# Altium project Relay-Driver-Board-v1.0.PrjPcb (part 1 of 3)
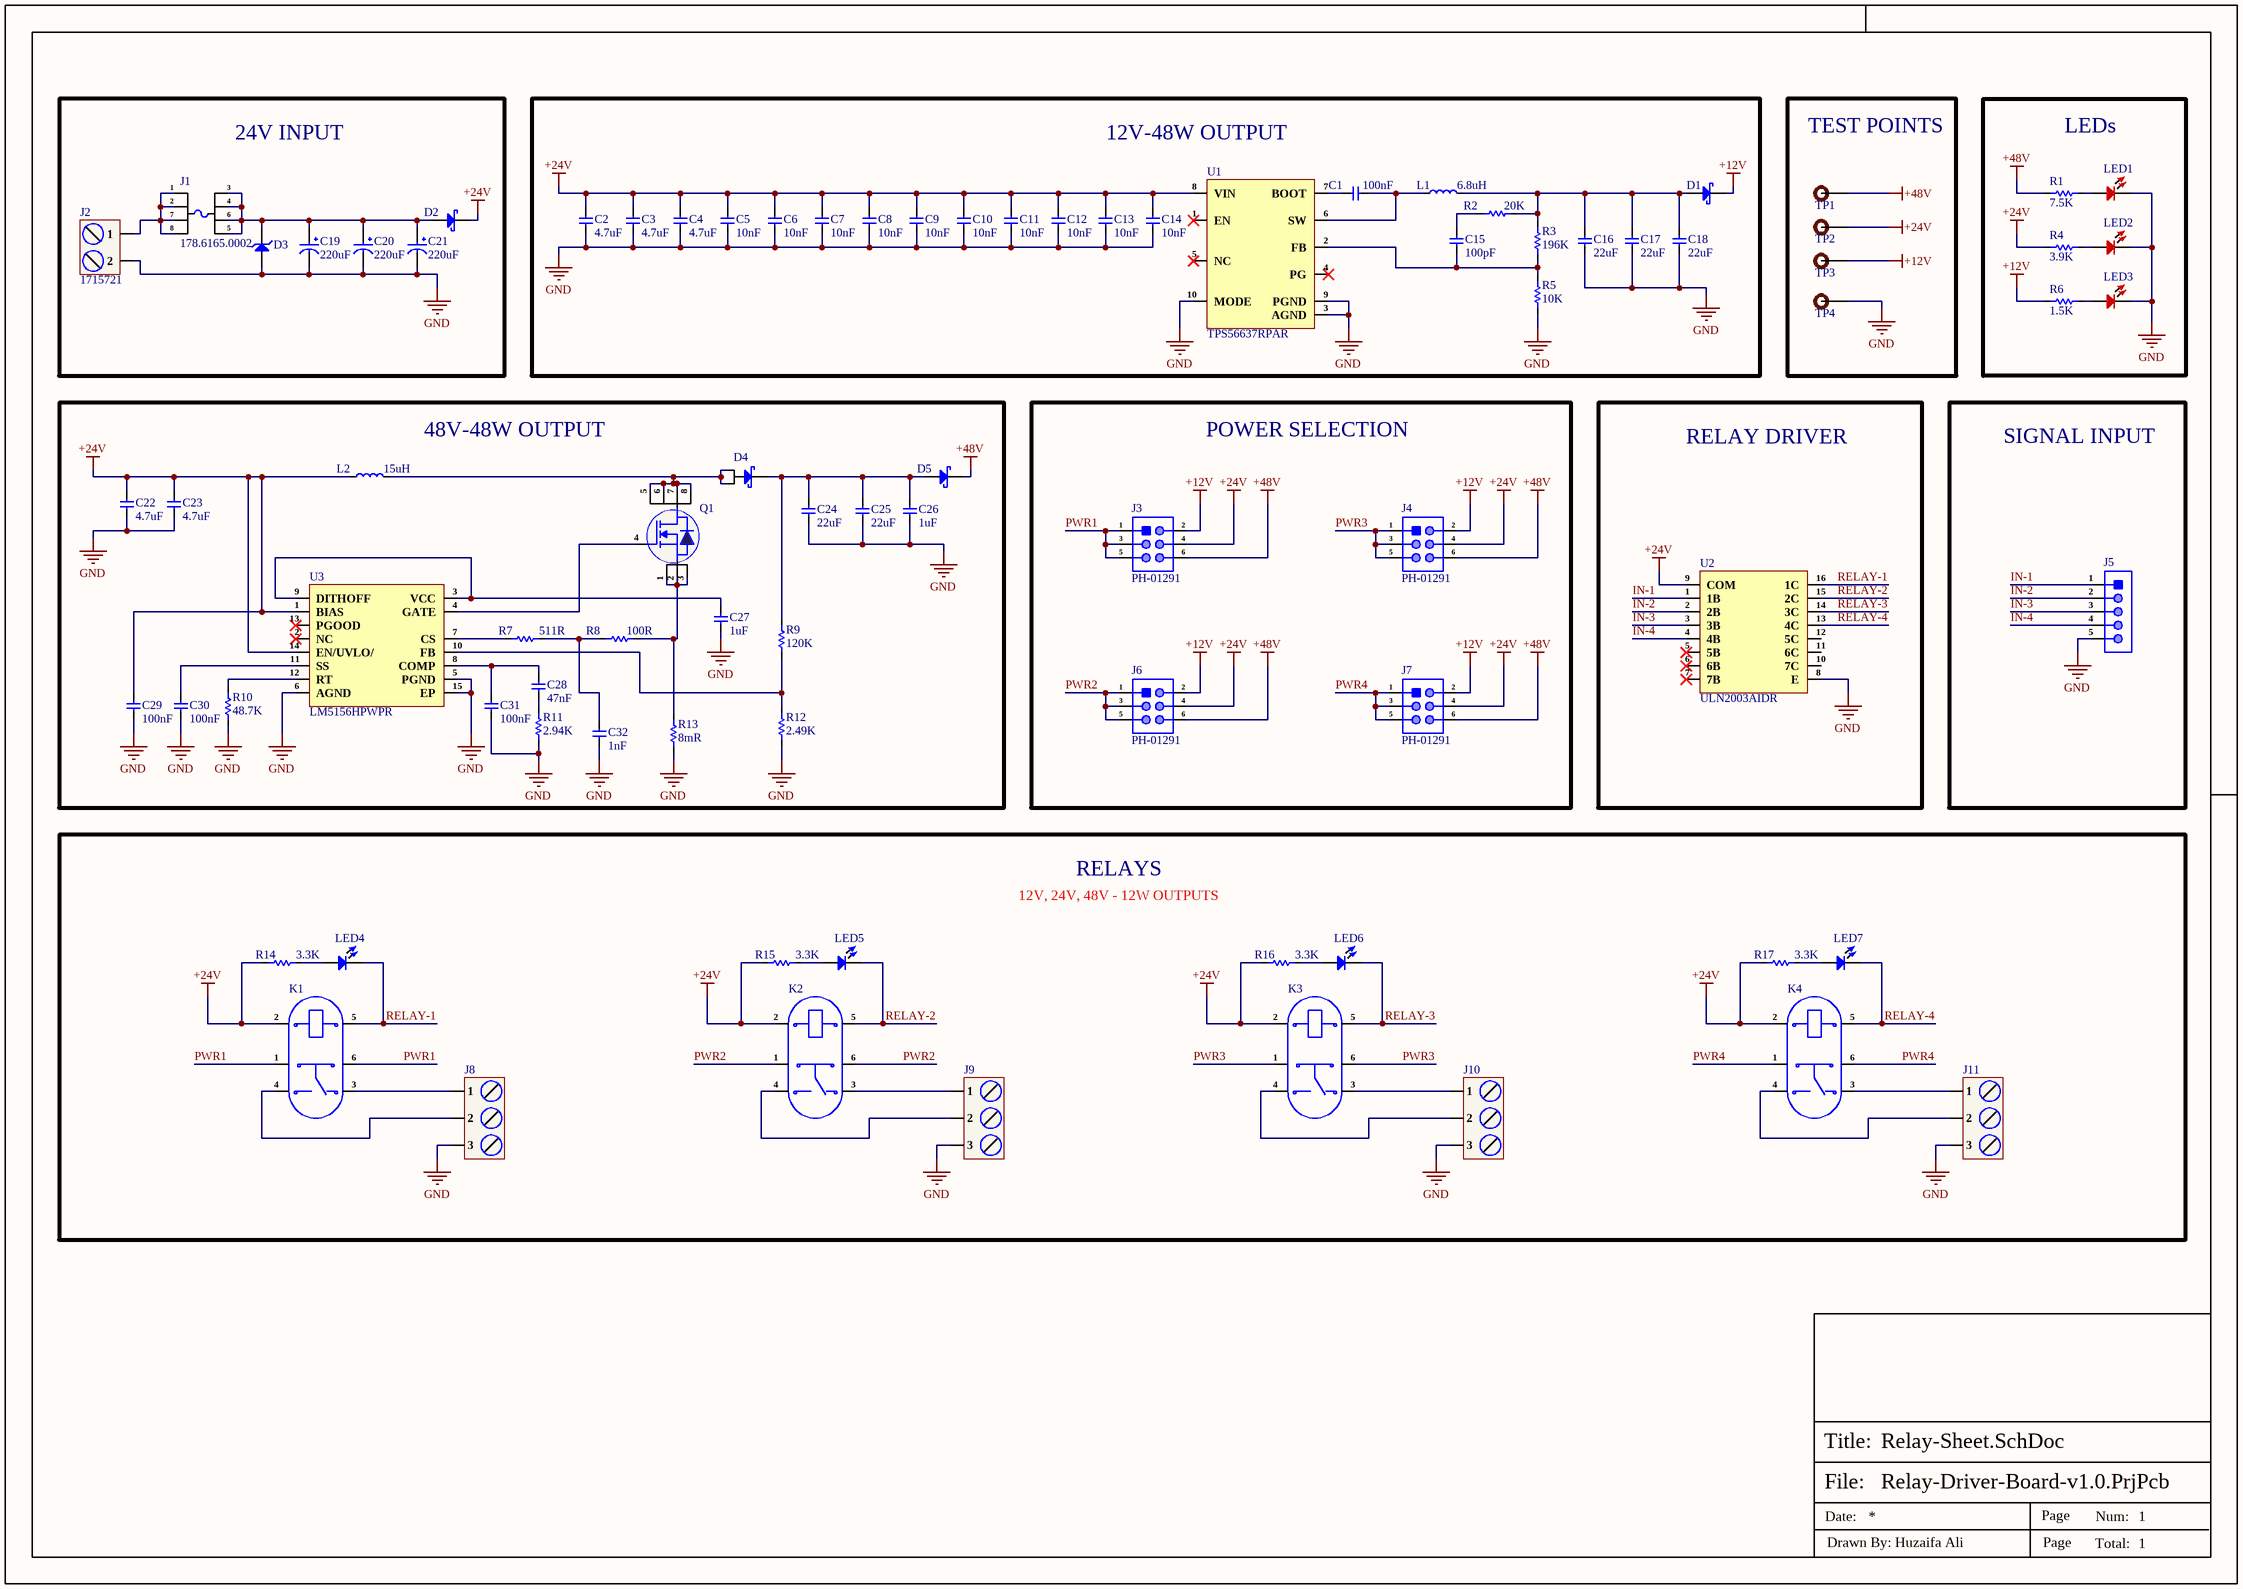
[diagram p0: Relay-Sheet.SchDoc]
1 sheet, 86 parts. Net scope: global (net labels, ports and power ports of the same name join across sheets).
Board file: Relay-Driver-Board-v1.0.PcbDoc

## Sheet Relay-Sheet.SchDoc
size 420 x 297 mm; SheetNumber: 1; SheetTotal: 1

### Parts
C1  100nF  [Cap-0603]
C2  4.7uF  [Cap-1206]
C3  4.7uF  [Cap-1206]
C4  4.7uF  [Cap-1206]
C5  10nF  [Cap-0402]
C6  10nF  [Cap-0402]
C7  10nF  [Cap-0402]
C8  10nF  [Cap-0402]
C9  10nF  [Cap-0402]
C10  10nF  [Cap-0402]
C11  10nF  [Cap-0402]
C12  10nF  [Cap-0402]
C13  10nF  [Cap-0402]
C14  10nF  [Cap-0402]
C15  100pF  [Cap-0402]
C16  22uF  [Cap-0805]
C17  22uF  [Cap-0805]
C18  22uF  [Cap-0805]
C19  220uF  [UCD-220uF-10mmDia]
C20  220uF  [UCD-220uF-10mmDia]
C21  220uF  [UCD-220uF-10mmDia]
C22  4.7uF  [Cap-1206]
C23  4.7uF  [Cap-1206]
C24  22uF  [Cap 2220]
C25  22uF  [Cap 2220]
C26  1uF  [Cap-1206]
C27  1uF  [Cap-0402]
C28  47nF  [Cap-0402]
C29  100nF  [Cap-0603]
C30  100nF  [Cap-0603]
C31  100nF  [Cap-0603]
C32  1nF  [Cap-0603]
D1  SS56  [SMA]  (value not drawn)
D2  SS56  [SMA]  (value not drawn)
D3  SMBJ28A-13-F  [SMB_]  (value not drawn)
D4  STPS20M100SG-TR  [D2Pak.]  (value not drawn)
D5  SS56  [SMA]  (value not drawn)
J1  178.6165.0002  [178.6165.0002]
J2  1715721  [1715721]
J3  PH-01291  [PH-01291]
J4  PH-01291  [PH-01291]
J5  B5B-XH-A(LF)(SN)  [B5B-XH-A(LF)(SN)_]  (value not drawn)
J6  PH-01291  [PH-01291]
J7  PH-01291  [PH-01291]
J8  DB128L-5.08-3P-BK-S  [DB128L-5.08-3P-BK-S]  (value not drawn)
J9  DB128L-5.08-3P-BK-S  [DB128L-5.08-3P-BK-S]  (value not drawn)
J10  DB128L-5.08-3P-BK-S  [DB128L-5.08-3P-BK-S]  (value not drawn)
J11  DB128L-5.08-3P-BK-S  [DB128L-5.08-3P-BK-S]  (value not drawn)
K1  HFD16/24-ZFH-3N  [HFD16/24-ZFH-3N]  (value not drawn)
K2  HFD16/24-ZFH-3N  [HFD16/24-ZFH-3N]  (value not drawn)
K3  HFD16/24-ZFH-3N  [HFD16/24-ZFH-3N]  (value not drawn)
K4  HFD16/24-ZFH-3N  [HFD16/24-ZFH-3N]  (value not drawn)
L1  6.8uH  [MWSA1206S-6R8MT]
L2  15uH  [FEXL1010A-150M]
LED1  RED  [LED-0603]  (value not drawn)
LED2  RED  [LED-0603]  (value not drawn)
LED3  RED  [LED-0603]  (value not drawn)
LED4  Blue  [LED-0603]  (value not drawn)
LED5  Blue  [LED-0603]  (value not drawn)
LED6  Blue  [LED-0603]  (value not drawn)
LED7  Blue  [LED-0603]  (value not drawn)
Q1  CSD19538Q3A  [VSONP-8(3.1x3.1)]  (value not drawn)
R1  7.5K  [Res-0402]
R2  20K  [Res-0402]
R3  196K  [Res-0603]
R4  3.9K  [Res-0402]
R5  10K  [Res-0402]
R6  1.5K  [Res-0402]
R7  511R  [Res-0402]
R8  100R  [Res-0402]
R9  120K  [Res-0402]
R10  48.7K  [Res-0603]
R11  2.94K  [Res-0402]
R12  2.49K  [Res-0402]
R13  8mR  [RES-2512]
R14  3.3K  [Res-0402]
R15  3.3K  [Res-0402]
R16  3.3K  [Res-0402]
R17  3.3K  [Res-0402]
TP1  TEST POINT  [Test-point]  (value not drawn)  (no BOM)
TP2  TEST POINT  [Test-point]  (value not drawn)  (no BOM)
TP3  TEST POINT  [Test-point]  (value not drawn)  (no BOM)
TP4  TEST POINT  [Test-point]  (value not drawn)  (no BOM)
U1  TPS56637RPAR  [10-VQFN-HR (3x3)]
U2  ULN2003AIDR  [16-SOIC (0.154", 3.90mm Width)]
U3  LM5156HPWPR  [HTSSOP-14-EP]

### Blocks framed on the sheet
24V INPUT: C19-C21 D2 D3 J1 J2
12V-48W OUTPUT: C1-C18 D1 L1 R2 R3 R5 U1
TEST POINTS: TP1-TP4
LEDs: LED1-LED3 R1 R4 R6
48V-48W OUTPUT: C22-C32 D4 D5 L2 Q1 R7-R13 U3
POWER SELECTION: J3 J4 J6 J7
RELAY DRIVER: U2
SIGNAL INPUT: J5
RELAYS: J8-J11 K1-K4 LED4-LED7 R14-R17

### Nets
+12V: D1.1(K) J3.2 J4.2 J6.2 J7.2 R6.1 TP3.1
+24V: C2.2 C3.2 C4.2 C5.2 C6.2 C7.2 C8.2 C9.2 C10.2 C11.2 C12.2 C13.2 C14.2 C22.2 C23.2 C29.1 D2.1(K) J3.4 J4.4 J6.4 J7.4 K1.2 K2.2 K3.2 K4.2 L2.1 R4.1 R14.1 R15.1 R16.1 R17.1 TP2.1 U1.8(VIN) U2.9(COM) U3.1(BIAS) U3.14(EN/UVLO/)
+48V: D5.1(K) J3.6 J4.6 J6.6 J7.6 R1.1 TP1.1
GND: C2.1 C3.1 C4.1 C5.1 C6.1 C7.1 C8.1 C9.1 C10.1 C11.1 C12.1 C13.1 C14.1 C16.1 C17.1 C18.1 C19.2 C20.2 C21.2 C22.1 C23.1 C24.1 C25.1 C26.1 C27.1 C29.2 C30.2 C31.2 C32.1 D3.1(A) J2.2 J5.5 J8.3 J9.3 J10.3 J11.3 LED1.2 LED2.2 LED3.2 R5.1 R10.1 R11.1 R12.1 R13.1 TP4.1 U1.3(AGND) U1.9(PGND) U1.10(MODE) U2.8(E) U3.5(PGND) U3.6(AGND) U3.15(EP)
IN-1: J5.1 U2.1(1B)
IN-2: J5.2 U2.2(2B)
IN-3: J5.3 U2.3(3B)
IN-4: J5.4 U2.4(4B)
PWR1: J3.1 J3.3 J3.5 K1.1 K1.6
PWR2: J6.1 J6.3 J6.5 K2.1 K2.6
PWR3: J4.1 J4.3 J4.5 K3.1 K3.6
PWR4: J7.1 J7.3 J7.5 K4.1 K4.6
RELAY-1: K1.5 LED4.2 U2.16(1C)
RELAY-2: K2.5 LED5.2 U2.15(2C)
RELAY-3: K3.5 LED6.2 U2.14(3C)
RELAY-4: K4.5 LED7.2 U2.13(4C)
NetC1_1: C1.1 L1.1 U1.6(SW)
NetC1_2: C1.2 U1.7(BOOT)
NetC15_1: C15.1 R3.1 R5.2 U1.2(FB)
NetC15_2: C15.2 R2.1
NetC16_2: C16.2 C17.2 C18.2 D1.2(A) L1.2 R2.2 R3.2
NetC19_1: C19.1 C20.1 C21.1 D2.2(A) D3.2(K) J1.3 J1.4 J1.5 J1.6
NetC24_2: C24.2 C25.2 C26.2 D4.3(K) D5.2(A) R9.2
NetC27_2: C27.2 U3.3(VCC) U3.9(DITHOFF)
NetC28_1: C28.1 R11.2
NetC28_2: C28.2 C31.1 U3.8(COMP)
NetC30_1: C30.1 U3.11(SS)
NetC32_2: C32.2 R7.2 R8.1
NetD4_1: D4.1(A) D4.2(A) L2.2 Q1.5(D) Q1.6(D) Q1.7(D) Q1.8(D)
NetJ1_1: J1.1 J1.2 J1.7 J1.8 J2.1
NetJ8_1: J8.1 K1.3
NetJ8_2: J8.2 K1.4
NetJ9_1: J9.1 K2.3
NetJ9_2: J9.2 K2.4
NetJ10_1: J10.1 K3.3
NetJ10_2: J10.2 K3.4
NetJ11_1: J11.1 K4.3
NetJ11_2: J11.2 K4.4
NetLED1_1: LED1.1 R1.2
NetLED2_1: LED2.1 R4.2
NetLED3_1: LED3.1 R6.2
NetLED4_1: LED4.1 R14.2
NetLED5_1: LED5.1 R15.2
NetLED6_1: LED6.1 R16.2
NetLED7_1: LED7.1 R17.2
NetQ1_1: Q1.1(S) Q1.2(S) Q1.3(S) R8.2 R13.2
NetQ1_4: Q1.4(G) U3.4(GATE)
NetR7_1: R7.1 U3.7(CS)
NetR9_1: R9.1 R12.2 U3.10(FB)
NetR10_2: R10.2 U3.12(RT)

Not connected (* = marked no-connect by the designer): U1 1(EN)* 4(PG)* 5(NC)*; U2 5(5B)* 6(6B)* 7(7B)* 10(7C) 11(6C) 12(5C); U3 2(NC)* 13(PGOOD)*

### Notes on the sheet
- 12V, 24V, 48V - 12W OUTPUTS
- File:
- Title:
- Date:
- Page
- Num:
- Total:
- Drawn By: Huzaifa Ali